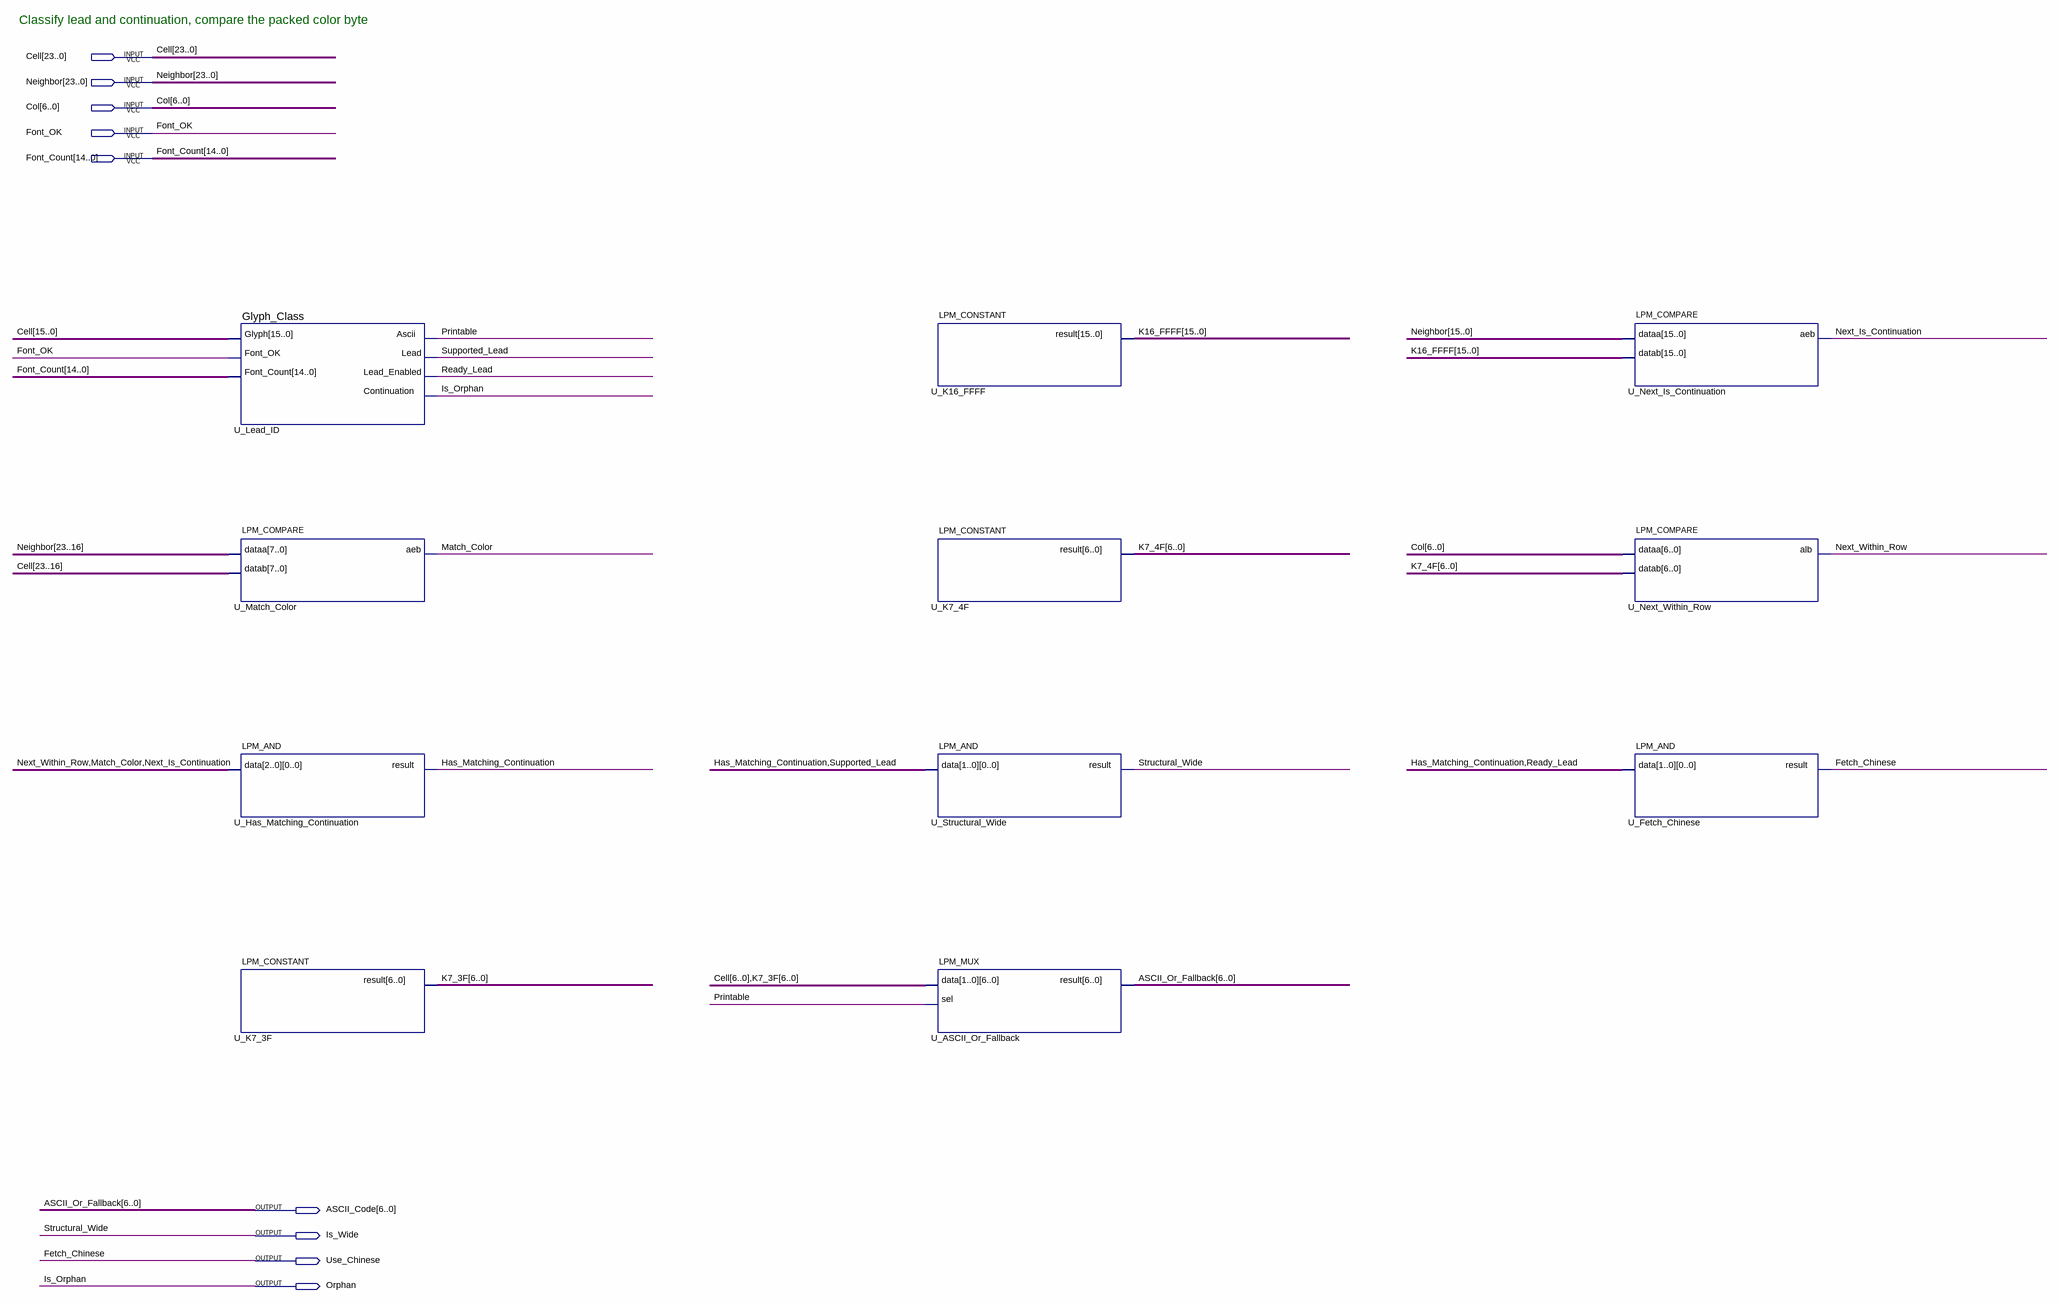
[diagram p0: schematic sheet]
// Quartus schematic Wide_Render.bdf as structural Verilog: 11 symbols, 9 pins
module Wide_Render (
  input  [23:0] Cell,
  input  [23:0] Neighbor,
  input  [6:0] Col,
  input  Font_OK,
  input  [14:0] Font_Count,
  output [6:0] ASCII_Code,
  output Is_Wide,
  output Use_Chinese,
  output Orphan
);

  wire Has_Matching_Continuation, Match_Color, Next_Is_Continuation, Next_Within_Row, Printable, Ready_Lead,
       Supported_Lead;
  wire [6:0] K7_3F, K7_4F;
  wire [15:0] K16_FFFF;

  Glyph_Class U_Lead_ID (
    .Glyph(Cell[15:0]), .Font_OK(Font_OK), .Font_Count(Font_Count), .Ascii(Printable), .Lead(Supported_Lead),
    .Lead_Enabled(Ready_Lead), .Continuation(Orphan));
  LPM_COMPARE #(.LPM_WIDTH(8), .LPM_REPRESENTATION("UNSIGNED")) U_Match_Color (
    .dataa(Neighbor[23:16]), .datab(Cell[23:16]), .aeb(Match_Color));
  LPM_AND #(.LPM_WIDTH(1), .LPM_SIZE(3)) U_Has_Matching_Continuation (
    .data({Next_Within_Row, Match_Color, Next_Is_Continuation}), .result(Has_Matching_Continuation));
  LPM_CONSTANT #(.LPM_WIDTH(7), .LPM_CVALUE(63)) U_K7_3F (.result(K7_3F));
  LPM_CONSTANT #(.LPM_WIDTH(16), .LPM_CVALUE(65535)) U_K16_FFFF (.result(K16_FFFF));
  LPM_CONSTANT #(.LPM_WIDTH(7), .LPM_CVALUE(79)) U_K7_4F (.result(K7_4F));
  LPM_AND #(.LPM_WIDTH(1), .LPM_SIZE(2)) U_Structural_Wide (
    .data({Has_Matching_Continuation, Supported_Lead}), .result(Is_Wide));
  LPM_MUX #(.LPM_WIDTH(7), .LPM_SIZE(2), .LPM_WIDTHS(1)) U_ASCII_Or_Fallback (
    .data({Cell[6:0], K7_3F}), .sel(Printable), .result(ASCII_Code));
  LPM_COMPARE #(.LPM_WIDTH(16), .LPM_REPRESENTATION("UNSIGNED")) U_Next_Is_Continuation (
    .dataa(Neighbor[15:0]), .datab(K16_FFFF), .aeb(Next_Is_Continuation));
  LPM_COMPARE #(.LPM_WIDTH(7), .LPM_REPRESENTATION("UNSIGNED")) U_Next_Within_Row (
    .dataa(Col), .datab(K7_4F), .alb(Next_Within_Row));
  LPM_AND #(.LPM_WIDTH(1), .LPM_SIZE(2)) U_Fetch_Chinese (
    .data({Has_Matching_Continuation, Ready_Lead}), .result(Use_Chinese));

  // Other names for the same wires on the sheet: ASCII_Or_Fallback[6:0] = ASCII_Code; Fetch_Chinese = Use_Chinese;
  //   Is_Orphan = Orphan; Structural_Wide = Is_Wide

  // Notes on the sheet:
  //   Classify lead and continuation, compare the packed color byte
endmodule
